# Altium schematic sheet Formula.SchDoc: ИЛ1397ТО1/1
size 410 x 297 mm; ApprovedBy: Стерхов В.Д; CheckedBy: Стерхов В.Д; Author: Сергеев Д.А.; CompanyName: ГК "СНАБЖЕНИЕ"; DrawnBy: Сергеев Д.А.; Engineer: Сергеев Д.А.; Organization: ГК "СНАБЖЕНИЕ"; DocumentNumber: ИЛ1397ТО1/1; SheetNumber: 3; SheetTotal: 3
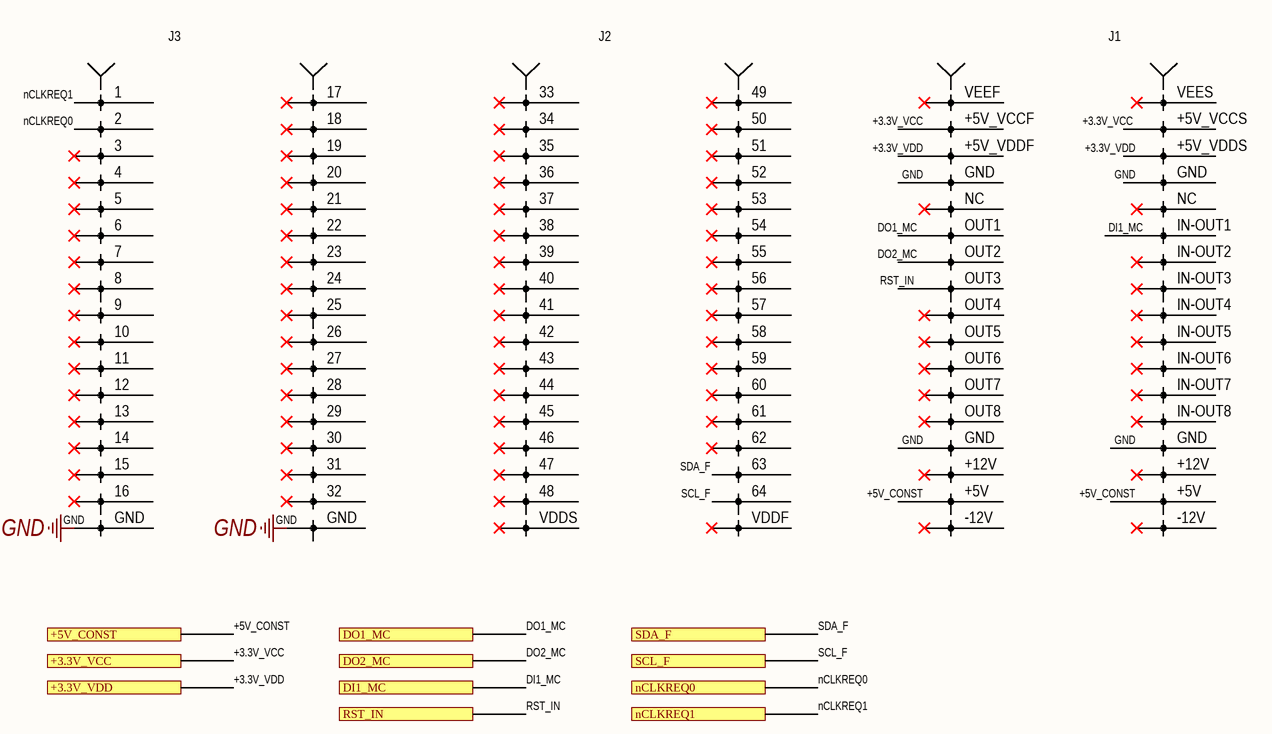
[diagram p0: Formula.SchDoc]

## Parts
X5  FORMULA  [FORMULA]  (value not drawn)

## Ports
+3.3V_VCC, +3.3V_VDD, +5V_CONST, DI1_MC, DO1_MC, DO2_MC, nCLKREQ0, nCLKREQ1, RST_IN, SCL_F, SDA_F

## Nets
GND: X5.GND
+3.3V_VCC: X5.+5V_VCCF(VCCF) X5.+5V_VCCS(VCCS) ; port +3.3V_VCC
+3.3V_VDD: X5.+5V_VDDF(VDDF) X5.+5V_VDDS(VDDS) ; port +3.3V_VDD
+5V_CONST: X5.+5V ; port +5V_CONST
DI1_MC: X5.IN-OUT1 ; port DI1_MC
DO1_MC: X5.OUT1 ; port DO1_MC
DO2_MC: X5.OUT2 ; port DO2_MC
nCLKREQ0: X5.2 ; port nCLKREQ0
nCLKREQ1: X5.1 ; port nCLKREQ1
RST_IN: X5.OUT3 ; port RST_IN
SCL_F: X5.64 ; port SCL_F
SDA_F: X5.63 ; port SDA_F

Not connected (* = marked no-connect by the designer): X5 3* 4* 5* 6* 7* 8* 9* 10* 11* 12* 13* 14* 15* 16* 17* 18* 19* 20* 21* 22* 23* 24* 25* 26* 27* 28* 29* 30* 31* 32* 33* 34* 35* 36(4)* 37(5)* 38* 39* 40* 41* 42* 43* 44* 45* 46* 47* 48* 49* 50* 51* 52* 53* 54* 55* 56* 57* 58* 59* 60* 61* 62* +12V* -12V* IN-OUT2* IN-OUT3* IN-OUT4* IN-OUT5* IN-OUT6* IN-OUT7* IN-OUT8* NC* OUT4* OUT5* OUT6* OUT7* OUT8* VDDF* VDDS* VEEF* VEES*

## Notes on the sheet
- Перв. примен.
- Справ. №
- Подп. и дата
- Инв. № дубл.
- Взам. инв. №
- Разраб.
- Изм.
- Лист
- № докум.
- Подп.
- Дата
- Литера
- Масса
- Масштаб
- Пров.
- Т.контр.
- Листов
- Инв. № подл.
- Н.контр.
- Утв.
- Форма 1 ГОСТ 2.104-2006
- Копировал
- Формат А3
- (in symbol FORMULA) J3; J2; J1